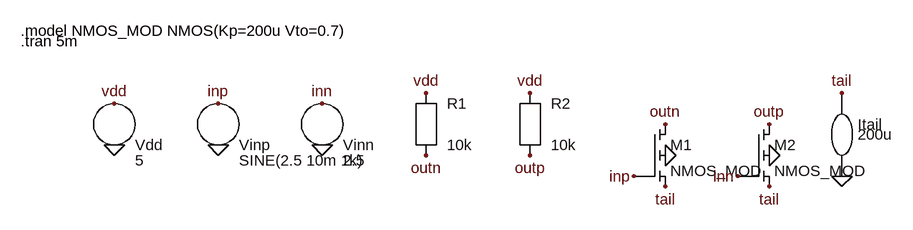
[diagram p0: schematic diff_pair_labelled.asc]
diff_pair_labelled.asc, the LTspice schematic file:
Version 4
SHEET 1 880 680
FLAG 160 128 vdd
FLAG 160 192 0
FLAG 320 128 inp
FLAG 320 192 0
FLAG 480 128 inn
FLAG 480 192 0
FLAG 640 112 vdd
FLAG 640 208 outn
FLAG 800 112 vdd
FLAG 800 208 outp
FLAG 1008 160 outn
FLAG 960 240 inp
FLAG 1008 256 tail
FLAG 1008 208 0
FLAG 1168 160 outp
FLAG 1120 240 inn
FLAG 1168 256 tail
FLAG 1168 208 0
FLAG 1280 112 tail
FLAG 1280 240 0
SYMBOL voltage 160 160 R0
SYMATTR InstName Vdd
SYMATTR Value 5
SYMBOL voltage 320 160 R0
SYMATTR InstName Vinp
SYMATTR Value SINE(2.5 10m 1k)
SYMBOL voltage 480 160 R0
SYMATTR InstName Vinn
SYMATTR Value 2.5
SYMBOL res 640 160 R0
SYMATTR InstName R1
SYMATTR Value 10k
SYMBOL res 800 160 R0
SYMATTR InstName R2
SYMATTR Value 10k
SYMBOL nmos4 960 160 R0
SYMATTR InstName M1
SYMATTR Value NMOS_MOD
SYMBOL nmos4 1120 160 R0
SYMATTR InstName M2
SYMATTR Value NMOS_MOD
SYMBOL current 1280 160 R0
SYMATTR InstName Itail
SYMATTR Value 200u
TEXT 16 16 Left 2 !.model NMOS_MOD NMOS(Kp=200u Vto=0.7)
TEXT 16 32 Left 2 !.tran 5m

The netlist it stands for:
* diff_pair_labelled.asc
Vdd vdd 0 5
Vinp inp 0 SINE(2.5 10m 1k)
Vinn inn 0 2.5
R1 vdd outn 10k
R2 vdd outp 10k
M1 outn inp tail 0 NMOS_MOD
M2 outp inn tail 0 NMOS_MOD
Itail tail 0 200u
.model NMOS NMOS
.model PMOS PMOS
.lib standard.mos
.model NMOS_MOD NMOS(Kp=200u Vto=0.7)
.tran 5m
.backanno
.end